# Altium schematic sheet signal-light-8.SchDoc
size A4; SheetNumber: 11; SheetTotal: 21
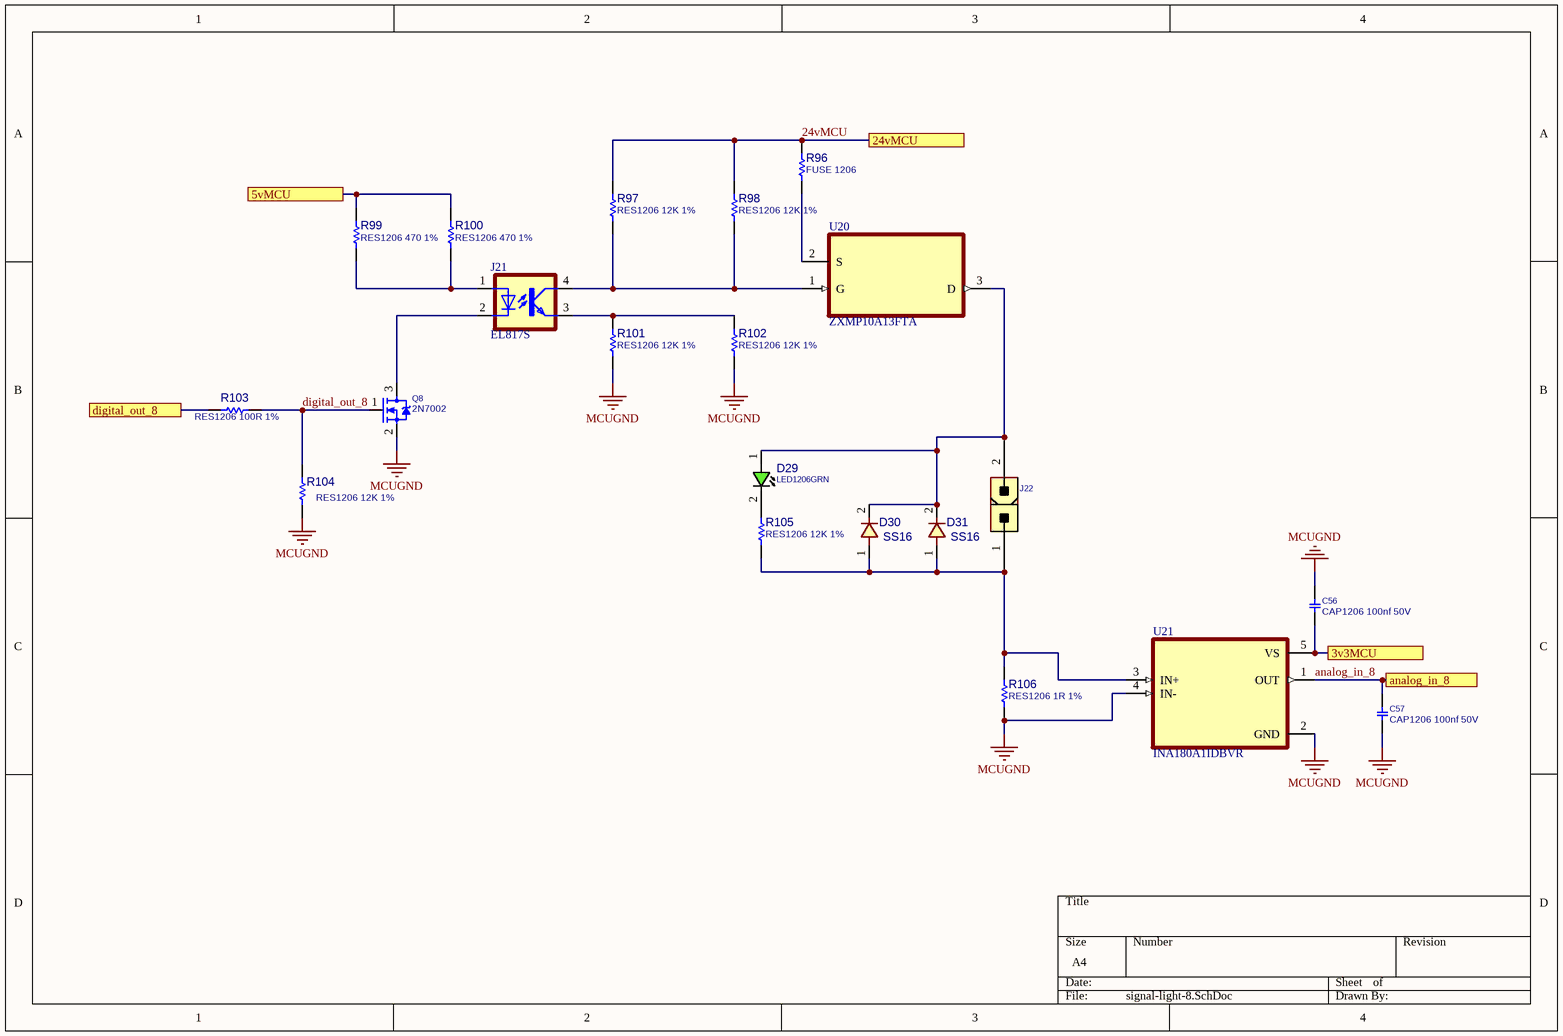
[diagram p0: signal-light-8.SchDoc]

## Parts
C56  CAP1206 100nf 50V  [C1206]
C57  CAP1206 100nf 50V  [C1206]
D29  LED1206GRN  [LED1206GRN]
D30  SS16  [D_SMA]
D31  SS16  [D_SMA]
J21  EL817S  [SOIC254P1030X460-4N]
J22  CONN_ATXPWR_2  [ATXPWR_2]  (value not drawn)
Q8  2N7002  [SOT23_3]
R96  FUSE 1206  [R1206]
R97  RES1206 12K 1%  [R1206]
R98  RES1206 12K 1%  [R1206]
R99  RES1206 470 1%  [R1206]
R100  RES1206 470 1%  [R1206]
R101  RES1206 12K 1%  [R1206]
R102  RES1206 12K 1%  [R1206]
R103  RES1206 100R 1%  [R1206]
R104  RES1206 12K 1%  [R1206]
R105  RES1206 12K 1%  [R1206]
R106  RES1206 1R 1%  [R1206]
U20  ZXMP10A13FTA  [SOT95P230X110-3N]
U21  INA180A1IDBVR  [SOT95P280X145-5N]

## Ports
3v3MCU, 5vMCU, 24vMCU, analog_in_8, digital_out_8

## Nets
MCUGND: C56.1 C57.2 Q8.2(SOURCE) R101.2 R102.2 R104.2 R106.2 U21.2(GND) U21.4(IN-)
3v3MCU: C56.2 U21.5(VS) ; port 3v3MCU
5vMCU: R99.2 R100.2 ; port 5vMCU
24vMCU: R96.1 R97.1 R98.1 ; port 24vMCU
analog_in_8: C57.1 U21.1(OUT) ; port analog_in_8
digital_out_8: Q8.1(GATE) R103.2 R104.1
digital_out_8: R103.1 ; port digital_out_8  [a separate net that carries the same name]
NetD29_1: D29.1(ANODE) D30.2 D31.2 J22.2 U20.3(D)
NetD29_2: D29.2(CATHODE) R105.1
NetD30_1: D30.1 D31.1 J22.1 R105.2 R106.1 U21.3(IN+)
NetJ21_1: J21.1(A) R99.1 R100.1
NetJ21_2: J21.2(C) Q8.3(DRAIN)
NetJ21_3: J21.3(EMIT) R101.1 R102.1
NetJ21_4: J21.4(COL) R97.2 R98.2 U20.1(G)
NetR96_2: R96.2 U20.2(S)

## Library data of the parts
C56 C57 = CAP_SMD_MLCC_1206: CAP, MLCC; PARAM: -, -%; MANF_P#: MANF_PART#; PARAM2: -V; PRICE: 100= 1$; MANF: -; ASSEMBLY: ASSEMBLY
D29 = LED_SMD_1206_GRN: LED, SMD, 1206, GREEN; PARAM: 20mA; DESC: DESCRIPTION; PARAM2: 2.2V; MANF: -; ASSEMBLY: ASSEMBLY; PRICE: 36t@Javan; MANF_P#: -; VALUE: LED1206GRN; MountType: SMT; PartType: LED
D30 D31 = DIODE_SMD_1N4001: DIODE, GENERAL PURPOSE, 50V/1A; DESC: DESCRIPTION; PARAM: 50V VRRM; PARAM2: 1A; MANF_P#: 1N4001; MANF: MANF; ASSEMBLY: ASSEMBLY; PRICE: PRICE; VALUE: SS16
J21 = EL817S: Optoisolator Transistor Output 5000Vrms 1 Channel 4-SMD; MF: Everlight Electronics; SnapEDA_Link: https://www.snapeda.com/parts/EL817S/Everlight+Electronics+Co+Ltd/view-part/?ref=snap; Package: SMD-4 Everlight Electronics Co Ltd; Value: *; MP: EL817S; Check_prices: https://www.snapeda.com/parts/EL817S/Everlight+Electronics+Co+Ltd/view-part/?ref=eda
J22 = CONN_ATXPWR_2: CONN, ATX POWER, 2 P; MANF: Molex; MANF_P#: 39281023; VALUE: CONN_ATXPWR_2; MountType: THD; PACKAGE: ATXPWR-2pin; Part Type: Conn.
Q8 = MOSN_2N7002_SOT23: MOSFET, N-CH, 60V, 0.3A; MANF: NXP; ASSEMBLY: ASSEMBLY; MANF_P#: 2N7002; PARAM2: 60v; PARAM: 0.3A; PRICE: 0.3t@Javan; VALUE: 2N7002
R96-R106 = RES_SMD_1206: RESISTOR, SMD; PARAM: 1%, 0.25W; DESC: DESCRIPTION; DIST#: MOUSER; MANF_P#: -; MANF: -; ASSEMBLY: ASSEMBLY; PRICE: -; PARAM2: -
U20 = ZXMP10A13FTA: P-Channel 100 V 600mA (Ta) 625mW (Ta) Surface Mount SOT-23-3; MF: Diodes Inc.; Purchase-URL: https://pricing.snapeda.com/search/part/ZXMP10A13FTA/?ref=eda; Package: SOT-23-3 Diodes Inc.; SnapEDA_Link: https://www.snapeda.com/parts/ZXMP10A13FTA/Diodes+Inc./view-part/?ref=snap; Availability: In Stock; Value: *; MP: ZXMP10A13FTA; Check_prices: https://www.snapeda.com/parts/ZXMP10A13FTA/Diodes+Inc./view-part/?ref=eda; Price: None
U21 = INA180A1IDBVR: 26V, 350kHz current sense amplifier; MF: Texas Instruments; SnapEDA_Link: https://www.snapeda.com/parts/INA180A1IDBVR/Texas+Instruments/view-part/?ref=snap; Package: SOT-23-5 Texas Instruments; Value: *; MP: INA180A1IDBVR; Check_prices: https://www.snapeda.com/parts/INA180A1IDBVR/Texas+Instruments/view-part/?ref=eda